# Altium schematic sheet Actuator_Power_and_Dynamixel_Bus.SchDoc
size 431 x 279 mm; SheetNumber: 3; SheetTotal: 5
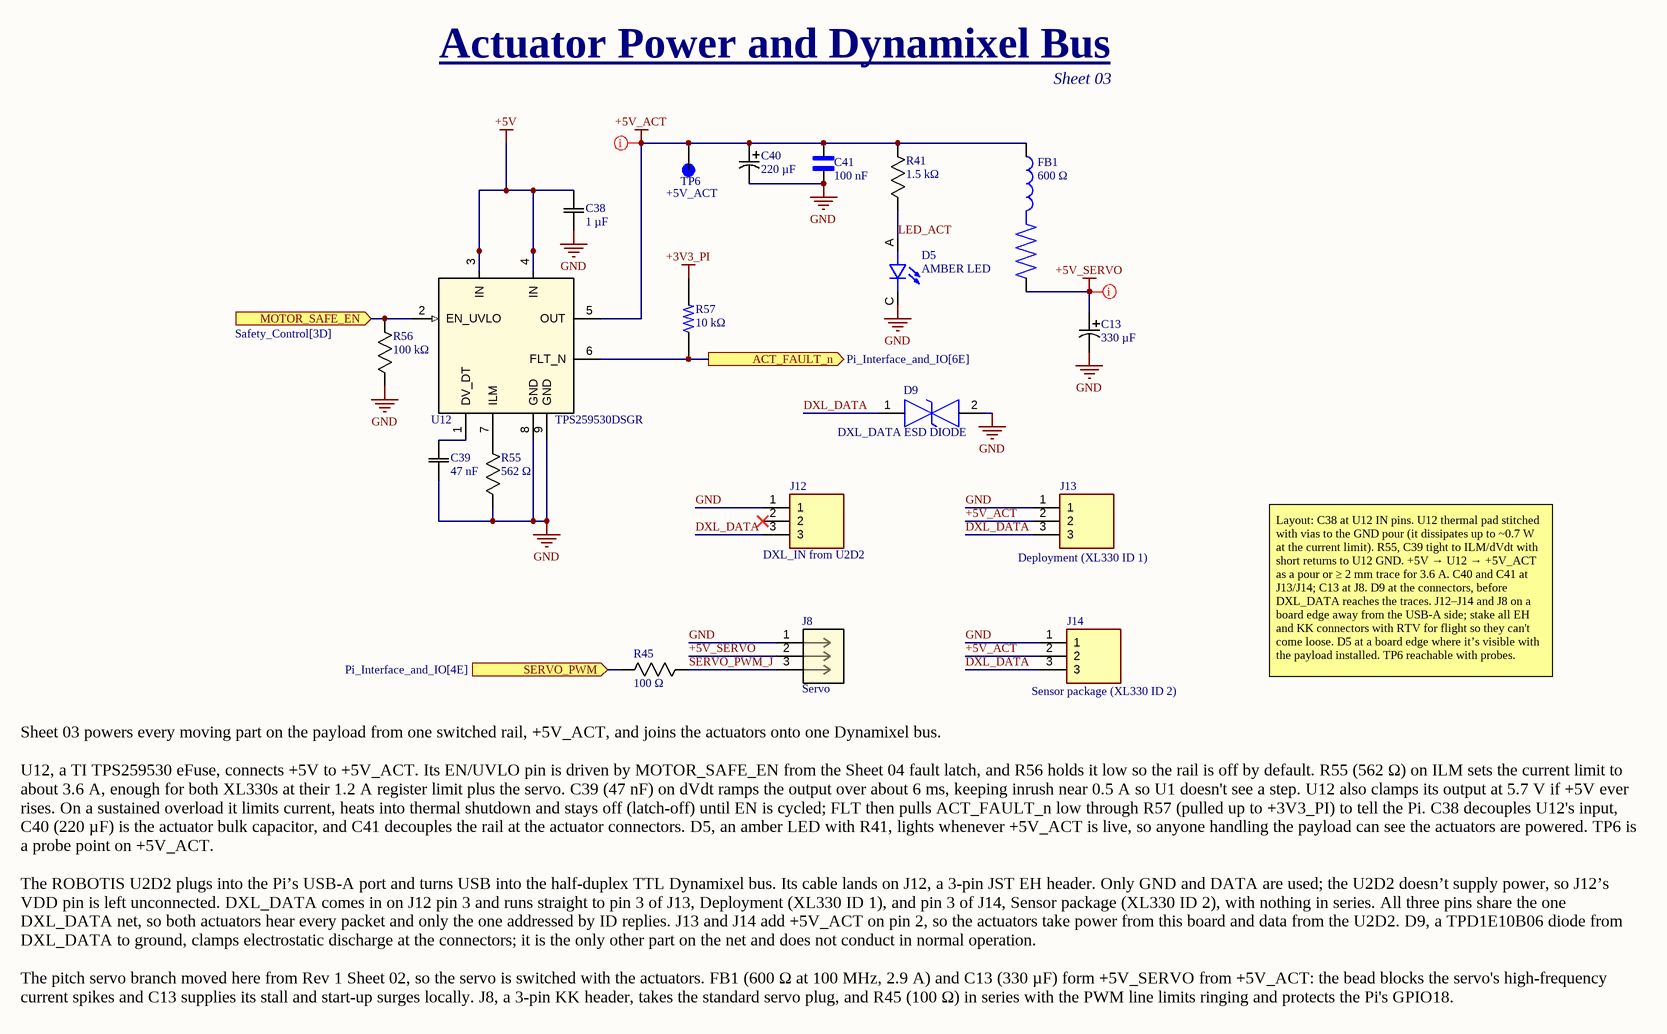
[diagram p0: Actuator_Power_and_Dynamixel_Bus.SchDoc]

## Parts
C13  330 µF  [CAP_EEFK_E_PAN]
C38  1 µF  [G-188_MUR]
C39  47 nF  [YAG_CC0603_YAG]
C40  220 µF  [CAP_EEFK_D_PAN]
C41  100 nF  [CAPC1608X90N]
D5  AMBER LED  [LEDC1608X55N]
D9  DXL_DATA ESD DIODE  [SODFL1608X77N]
FB1  600 Ω  [BEADC3216X180N]
J8  Servo  [CONN_A-6373-03A_MOL]
J12  DXL_IN from U2D2  [B3BEHALFSN]
J13  Deployment (XL330 ID 1)  [B3BEHALFSN]
J14  Sensor package (XL330 ID 2)  [B3BEHALFSN]
R41  1.5 kΩ  [RC0603N_YAG]
R45  100 Ω  [RC0603N_YAG]
R55  562 Ω  [RC0603N_YAG]
R56  100 kΩ  [RC0603N_YAG]
R57  10 kΩ  [RESC1607X60N]
TP6  +5V_ACT  [KEYSTONE_5015]
U12  TPS259530DSGR  [DSG0008A]

## Ports
ACT_FAULT_n (out, see Pi_Interface_and_IO[6E]), MOTOR_SAFE_EN (in, see Safety_Control[3D]), SERVO_PWM (in, see Pi_Interface_and_IO[4E])

## Nets
+3V3_PI: R57.2
+5V: C38.2 U12.3(IN) U12.4(IN)
+5V_ACT: C40.1 C41.2 FB1.1 J13.2 J14.2 R41.1 TP6.TP U12.5(OUT)
+5V_SERVO: C13.1 FB1.2 J8.2
GND: C13.2 C38.1 C39.2 C40.2 C41.1 D5.C D9.2 J8.1 J12.1 J13.1 J14.1 R55.2 R56.1 U12.8(GND) U12.9(GND)
ACT_FAULT_n: R57.1 U12.6(FLT_N) ; port ACT_FAULT_n
DXL_DATA: D9.1 J12.3 J13.3 J14.3
LED_ACT: D5.A R41.2
MOTOR_SAFE_EN: R56.2 U12.2(EN_UVLO) ; port MOTOR_SAFE_EN
SERVO_PWM: R45.2 ; port SERVO_PWM
SERVO_PWM_J: J8.3 R45.1
NetC39_1: C39.1 U12.1(DV_DT)
NetR55_1: R55.1 U12.7(ILM)

Not connected (* = marked no-connect by the designer): J12 2*

## Layout directives
net class POWER_HI: +5V_ACT, +5V_SERVO

## Notes on the sheet
- Actuator Power and Dynamixel Bus
- Sheet 03
- Layout: C38 at U12 IN pins. U12 thermal pad stitched with vias to the GND pour (it dissipates up to ~0.7 W at the current limit). R55, C39 tight to ILM/dVdt with short returns to U12 GND. +5V → U12 → +5V_ACT as a pour or ≥ 2 mm trace for 3.6 A. C40 and C41 at J13/J14; C13 at J8. D9 at the connectors, before DXL_DATA reaches the traces. J12–J14 and J8 on a board edge away from the USB-A side; stake all EH and KK connectors with RTV for flight so they can't come loose. D5 at a board edge where it’s visible with the payload installed. TP6 reachable with probes.
- Sheet 03 powers every moving part on the payload from one switched rail, +5V_ACT, and joins the actuators onto one Dynamixel bus.
  U12, a TI TPS259530 eFuse, connects +5V to +5V_ACT. Its EN/UVLO pin is driven by MOTOR_SAFE_EN from the Sheet 04 fault latch, and R56 holds it low so the rail is off by default. R55 (562 Ω) on ILM sets the current limit to about 3.6 A, enough for both XL330s at their 1.2 A register limit plus the servo. C39 (47 nF) on dVdt ramps the output over about 6 ms, keeping inrush near 0.5 A so U1 doesn't see a step. U12 also clamps its output at 5.7 V if +5V ever rises. On a sustained overload it limits current, heats into thermal shutdown and stays off (latch-off) until EN is cycled; FLT then pulls ACT_FAULT_n low through R57 (pulled up to +3V3_PI) to tell the Pi. C38 decouples U12's input, C40 (220 µF) is the actuator bulk capacitor, and C41 decouples the rail at the actuator connectors. D5, an amber LED with R41, lights whenever +5V_ACT is live, so anyone handling the payload can see the actuators are powered. TP6 is a probe point on +5V_ACT.
  The ROBOTIS U2D2 plugs into the Pi’s USB-A port and turns USB into the half-duplex TTL Dynamixel bus. Its cable lands on J12, a 3-pin JST EH header. Only GND and DATA are used; the U2D2 doesn’t supply power, so J12’s VDD pin is left unconnected. DXL_DATA comes in on J12 pin 3 and runs straight to pin 3 of J13, Deployment (XL330 ID 1), and pin 3 of J14, Sensor package (XL330 ID 2), with nothing in series. All three pins share the one DXL_DATA net, so both actuators hear every packet and only the one addressed by ID replies. J13 and J14 add +5V_ACT on pin 2, so the actuators take power from this board and data from the U2D2. D9, a TPD1E10B06 diode from DXL_DATA to ground, clamps electrostatic discharge at the connectors; it is the only other part on the net and does not conduct in normal operation.
  The pitch servo branch moved here from Rev 1 Sheet 02, so the servo is switched with the actuators. FB1 (600 Ω at 100 MHz, 2.9 A) and C13 (330 µF) form +5V_SERVO from +5V_ACT: the bead blocks the servo's high-frequency current spikes and C13 supplies its stall and start-up surges locally. J8, a 3-pin KK header, takes the standard servo plug, and R45 (100 Ω) in series with the PWM line limits ringing and protects the Pi's GPIO18.
- DWG. NO.
- REV.
- SHT.
- THIS DOCUMENT AND THE DATA DISCLOSED HEREIN OR HEREWITH IS THE PROPERTY OF ALTIUM LIMITED AND MAY BE FREELY DISTRIBUTED IN WHOLE. NO RIGHTS ARE RESERVED OR EXPRESS OR IMPLIED WARANTEE GIVEN.
- REVISION
- DESCRIPTION
- DATE
- APPROVED
- ENG:
- APPROVALS
- PROJECT
- DSN:
- CHK:
- REFERENCE DOCUMENTS
- PROJECT REVISION:
- TITLE
- DOCUMENT REVISION:
- DESIGN ITEM:
- BOM:
- FAB DWG:
- PCB DWG:
- ASSY DWG:
- SCALE:
- SIZE
- B
- CAGE CODE
- FILE NAME
- DWG NO.
- SHEET
- OF
- REV

## Library data of the parts
C13 = EEE-FK0J331P: Panasonic EEE-FK0J331P / 330 µF 6.3 V aluminum (was 470 µF; reduced to keep U1 under 1000 µF) / SMD can / Servo bulk at J8 / https://www.digikey.com/en/products/result?keywords=EEE-FK0J331P; Copyright: Copyright (C) 2026 Ultra Librarian. All rights reserved.; Manufacturer_Name: Panasonic; Manufacturer_Part_Number: EEE-FK0J331P
C38 = GRM188R71A105KA61D: Murata GRM188R71A105KA61D / 1 µF 10 V X7R / 0603 / U12 input decoupling / https://octopart.com/search?q=GRM188R71A105KA61D; Copyright: Copyright (C) 2025 Ultra Librarian. All rights reserved.; Manufacturer_Name: Murata; Manufacturer_Part_Number: GRM188R71A105KA61D
C39 = CC0603KRX7R9BB473: Yageo CC0603KRX7R9BB473 / 47 nF 50 V X7R / 0603 / dVdt: about 0.9 V/ms, 6 ms ramp / https://www.digikey.com/en/products/result?keywords=CC0603KRX7R9BB473; Copyright: Copyright (C) 2026 Ultra Librarian. All rights reserved.; Manufacturer_Name: Yageo; Manufacturer_Part_Number: CC0603KRX7R9BB473
C40 = EEE-FK0J221P: Panasonic EEE-FK0J221P / 220 µF 6.3 V aluminum / SMD can / +5V_ACT bulk at J13/J14 / https://octopart.com/part/panasonic/EEE-FK0J221P; Copyright: Copyright (C) 2026 Ultra Librarian. All rights reserved.; Manufacturer_Name: Panasonic; Manufacturer_Part_Number: EEE-FK0J221P
C41 = GRM188R71H104KA93D: SMD Capacitor X7R(EIA) with Capacitance: 0.10uF Tol. 10%. Rated Voltage: 50Vdc / Murata GRM188R71H104KA93D / 100 nF 50 V X7R / 0603 / +5V_ACT decoupling at the connectors / https://www.digikey.com/en/products/result?keywords=GRM188R71H104KA93D; SnapEDA_Link: https://www.snapeda.com/parts/GRM188R71H104KA93D/Murata/view-part/?ref=snap; Package: 1608 Murata; Value: *; MF: Murata; MP: GRM188R71H104KA93D; Check_prices: https://www.snapeda.com/parts/GRM188R71H104KA93D/Murata/view-part/?ref=eda
D5 = LTST-C191KFKT: Orange 605nm LED Indication - Discrete 2V 0603 (1608 Metric) / LTST-C191KFKT / Lite-On LTST-C191KFKT / Orange/amber 605 nm / 0603 / Actuator-rail-live indicator / https://www.digikey.com/en/products/detail/lite-on-inc/LTST-C191KFKT/386833; MF: Lite-On Inc.; Check_prices: https://www.snapeda.com/parts/LTST-C191KFKT/Lite-On+Inc./view-part/?ref=eda; Availability: In Stock; Price: None; Package: 0603 Lite-On; MP: LTST-C191KFKT; Value: *; SnapEDA_Link: https://www.snapeda.com/parts/LTST-C191KFKT/Lite-On+Inc./view-part/?ref=snap; Purchase-URL: https://pricing.snapeda.com/search/part/LTST-C191KFKT/?ref=eda
D9 = TPD1E10B06DYAR: ESD Suppressors / TVS Diodes 12-pF, +/-5.5V, +/-30-kV ESD protection diode in 0402 and SOD-523 package TPD1E10B06DYAR / TI TPD1E10B06DYAR / Bidirectional ESD diode, 6 V working / SOD-523 (DYA) / DXL_DATA ESD / https://www.digikey.com/en/products/detail/texas-instruments/TPD1E10B06DYAR/15853876; Manufacturer_Name: Texas Instruments; Geometry.Height: 0.77mm; Manufacturer_Part_Number: TPD1E10B06DYAR; Mouser Part Number: 595-TPD1E10B06DYAR; Mouser Price/Stock: https://www.mouser.co.uk/ProductDetail/Texas-Instruments/TPD1E10B06DYAR?qs=Rp5uXu7WBW9%2F66n97S3Kgw%3D%3D; Arrow Part Number: TPD1E10B06DYAR; Arrow Price/Stock: https://www.arrow.com/en/products/tpd1e10b06dyar/texas-instruments.html?utm_currency=USD&region=nac; Datasheet Link: https://www.ti.com/lit/ds/symlink/tpd1e10b06.pdf?ts=1676259025619&ref_url=https%253A%252F%252Fwww.ti.com%252Fproduct%252FTPD1E10B06%252Fpart-details%252FTPD1E10B06DYAR
FB1 = BLM31KN601SN1L: 600 Ohms @ 100MHz 1 Power Line Ferrite Bead 1206 _3216 Metric_ 2.9A 38mOhm / Murata BLM31KN601SN1L / 600 Ω at 100 MHz, 2.9 A, 38 mΩ / https://www.digikey.com/en/products/detail/murata-electronics/BLM31KN601SN1L/7564098; MP: BLM31KN601SN1L; Availability: Unavailable; SnapEDA_Link: https://www.snapeda.com/parts/BLM31KN601SN1L/Murata/view-part/4302166/?ref=snap; Package: 3216 Murata; MF: Murata; Price: None; Value: *
J8 = 22232031: KK 254 Solid Header, Vertical, with Friction Lock, 3 Circuits, Tin (Sn) Plating, Bag / Molex 22-23-2031 / 3-pin 2.54 mm KK, friction lock / THT, vertical / Servo (standard servo plug fits) / https://www.digikey.com/en/products/result?keywords=22-23-2031; Manufacturer_Name: Molex Connector Corporation; Copyright: Copyright (C) 2025 Ultra Librarian. All rights reserved.; Manufacturer_Part_Number: 22232031; RefDes: RefDes; Type: Type
J12 = B3B-EH-A__LF___SN_: 3 way 1 row top entry header,2.5mm pitch JST EH Series, 2.5mm Pitch 3 Way 1 Row Straight PCB Header, Solder Termination, 3A / JST B3B-EH-A(LF)(SN) / 3-pin EH, 2.5 mm, 3 A / THT, vertical / DXL_IN from the U2D2 (pin 2 VDD not connected) / https://www.digikey.com/en/products/result?keywords=B3B-EH-A / https://octopart.com/part/jst/B3B-EH-A%28LF%29%28SN%29?slid=a2ca3f22-0411-4852-8878-7eb0f241f67c&ssid=41117a84-245e-4aff-a845-413bdd9f3cb2#CadModels; Manufacturer_Name: JST (JAPAN SOLDERLESS TERMINALS); Geometry.Height: 6mm; Manufacturer_Part_Number: B3B-EH-A (LF) (SN); Mouser Part Number: *; Mouser Price/Stock: *; Arrow Part Number: *; Arrow Price/Stock: *; Datasheet Link: http://www.jst-mfg.com/product/pdf/eng/eEH.pdf
J13 = B3B-EH-A__LF___SN_: 3 way 1 row top entry header,2.5mm pitch JST EH Series, 2.5mm Pitch 3 Way 1 Row Straight PCB Header, Solder Termination, 3A / JST B3B-EH-A(LF)(SN) / 3-pin EH, 2.5 mm, 3 A / THT, vertical / ) / https://www.digikey.com/en/products/result?keywords=B3B-EH-A / https://octopart.com/part/jst/B3B-EH-A%28LF%29%28SN%29?slid=a2ca3f22-0411-4852-8878-7eb0f241f67c&ssid=41117a84-245e-4aff-a845-413bdd9f3cb2#CadModels; Manufacturer_Name: JST (JAPAN SOLDERLESS TERMINALS); Geometry.Height: 6mm; Manufacturer_Part_Number: B3B-EH-A (LF) (SN); Mouser Part Number: *; Mouser Price/Stock: *; Arrow Part Number: *; Arrow Price/Stock: *; Datasheet Link: http://www.jst-mfg.com/product/pdf/eng/eEH.pdf
J14 = B3B-EH-A__LF___SN_: 3 way 1 row top entry header,2.5mm pitch JST EH Series, 2.5mm Pitch 3 Way 1 Row Straight PCB Header, Solder Termination, 3A / JST B3B-EH-A(LF)(SN) / 3-pin EH, 2.5 mm, 3 A / THT, vertical / https://www.digikey.com/en/products/result?keywords=B3B-EH-A / https://octopart.com/part/jst/B3B-EH-A%28LF%29%28SN%29?slid=a2ca3f22-0411-4852-8878-7eb0f241f67c&ssid=41117a84-245e-4aff-a845-413bdd9f3cb2#CadModels; Manufacturer_Name: JST (JAPAN SOLDERLESS TERMINALS); Geometry.Height: 6mm; Manufacturer_Part_Number: B3B-EH-A (LF) (SN); Mouser Part Number: *; Mouser Price/Stock: *; Arrow Part Number: *; Arrow Price/Stock: *; Datasheet Link: http://www.jst-mfg.com/product/pdf/eng/eEH.pdf
R41 = RC0603FR-0715KL: RES SMD 15K OHM 1% 1/10W 0603 / Yageo RC0603FR-071K5L / 1.5 kΩ 1 % / 0603 / D5 current: (5.14 − 2.0) / 1.5 kΩ ≈ 2.1 mA / https://www.digikey.com/en/products/result?keywords=RC0603FR-071K5L; Copyright: Copyright (C) 2026 Ultra Librarian. All rights reserved.; Manufacturer_Name: Yageo; Manufacturer_Part_Number: RC0603FR-0715KL
R45 = RC0603FR-07100RL: Yageo RC0603FR-07100RL / 100 Ω 1 % / 0603 / Servo PWM series / https://www.digikey.com/en/products/result?keywords=RC0603FR-07100RL; Copyright: Copyright (C) 2026 Ultra Librarian. All rights reserved.; Manufacturer_Name: Yageo; Manufacturer_Part_Number: RC0603FR-07100RL
R55 = RC0603FR-07562RL: Yageo RC0603FR-07562RL / 562 Ω 1 % / 0603 / ILM: I_LIM = 2000 / 562 + 0.04 ≈ 3.6 A (verify equation) / https://www.digikey.com/en/products/result?keywords=RC0603FR-07562RL; Copyright: Copyright (C) 2026 Ultra Librarian. All rights reserved.; Manufacturer_Name: Yageo; Manufacturer_Part_Number: RC0603FR-07562RL
R56 = RC0603FR-07100KL: RES, 100 k, 1%, 0.1 W, 0603 / Yageo RC0603FR-07100KL / 100 kΩ 1 % / 0603 / U12 EN pulldown: actuators off by default / https://www.digikey.com/en/products/result?keywords=RC0603FR-07100KL; Copyright: Copyright (C) 2025 Ultra Librarian. All rights reserved.; Manufacturer_Name: Yageo; Manufacturer_Part_Number: RC0603FR-07100KL
R57 = RC0603FR-0710KL: 10 kOhms Â±1% 0.1W, 1/10W Chip Resistor 0603 (1608 Metric) Moisture Resistant Thick Film / Yageo RC0603FR-0710KL / 10 kΩ 1 % / 0603 / FLT pull-up to +3V3_PI (ACT_FAULT_n) / https://www.digikey.com/en/products/result?keywords=RC0603FR-0710KL; SnapEDA_Link: https://www.snapeda.com/parts/RC0603FR-0710KL/Yageo/view-part/?ref=snap; Package: 0603 Yageo; Value: *; MF: Yageo; MP: RC0603FR-0710KL; Check_prices: https://www.snapeda.com/parts/RC0603FR-0710KL/Yageo/view-part/?ref=eda
TP6 = 5015: Test Point Micro Mini SMT Phos Bronze/Silver 1000pc Tape & Reel | Keystone Electronics 5015 / Keystone 5015 / SMT test point / SMD / +5V_ACT / https://www.digikey.ca/en/products/detail/keystone-electronics/5015/278886; SnapEDA_Link: https://www.snapeda.com/parts/5015/Keystone/view-part/?ref=snap; Package: None; Value: *; MF: Keystone Electronics; MP: 5015; Check_prices: https://www.snapeda.com/parts/5015/Keystone/view-part/?ref=eda
U12 = TPS259530DSGR: 2.7-V to 18-V, 34m&Omega;, 0.5-4A eFuse with over voltage protection in small WSON package 8-WSON -40 to 125; Manufacturer_Name: Texas Instruments; TYPE: TYPE; RefDes: RefDes; Copyright: Copyright (C) 2025 Ultra Librarian. All rights reserved.; Manufacturer_Part_Number: TPS259530DSGR